# Altium schematic sheet pin_text.SchDoc
size 254 x 203 mm
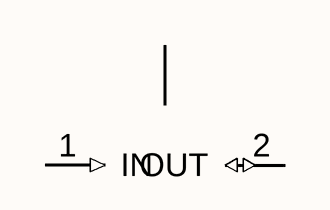
[diagram p0: pin_text.SchDoc]

## Parts
?  (no value)

## Nets

Not connected (* = marked no-connect by the designer): ? 1(IN) 2(OUT) 3(VCC)

## Library data of the parts
? = Buffer